# Altium schematic sheet DDR4_UDIMM CHANNEL-A0.schdoc
size 420 x 298 mm; Symbol: Sheet-Symbol_A3; Company: 嘉立创EDA; Version: V1.0; Page Size: A3; @Project Name: 【全网首发】X86电脑主板_copy; @Page Count: 2; @Update Date: 2025-11-04; @Create Date: 2025-11-04; @Schematic Name: SCHEMATIC1_1; @Page No: 0; @Page Name: DDR4_UDIMM CHANNEL-A0; Device: Sheet-Symbol_A3
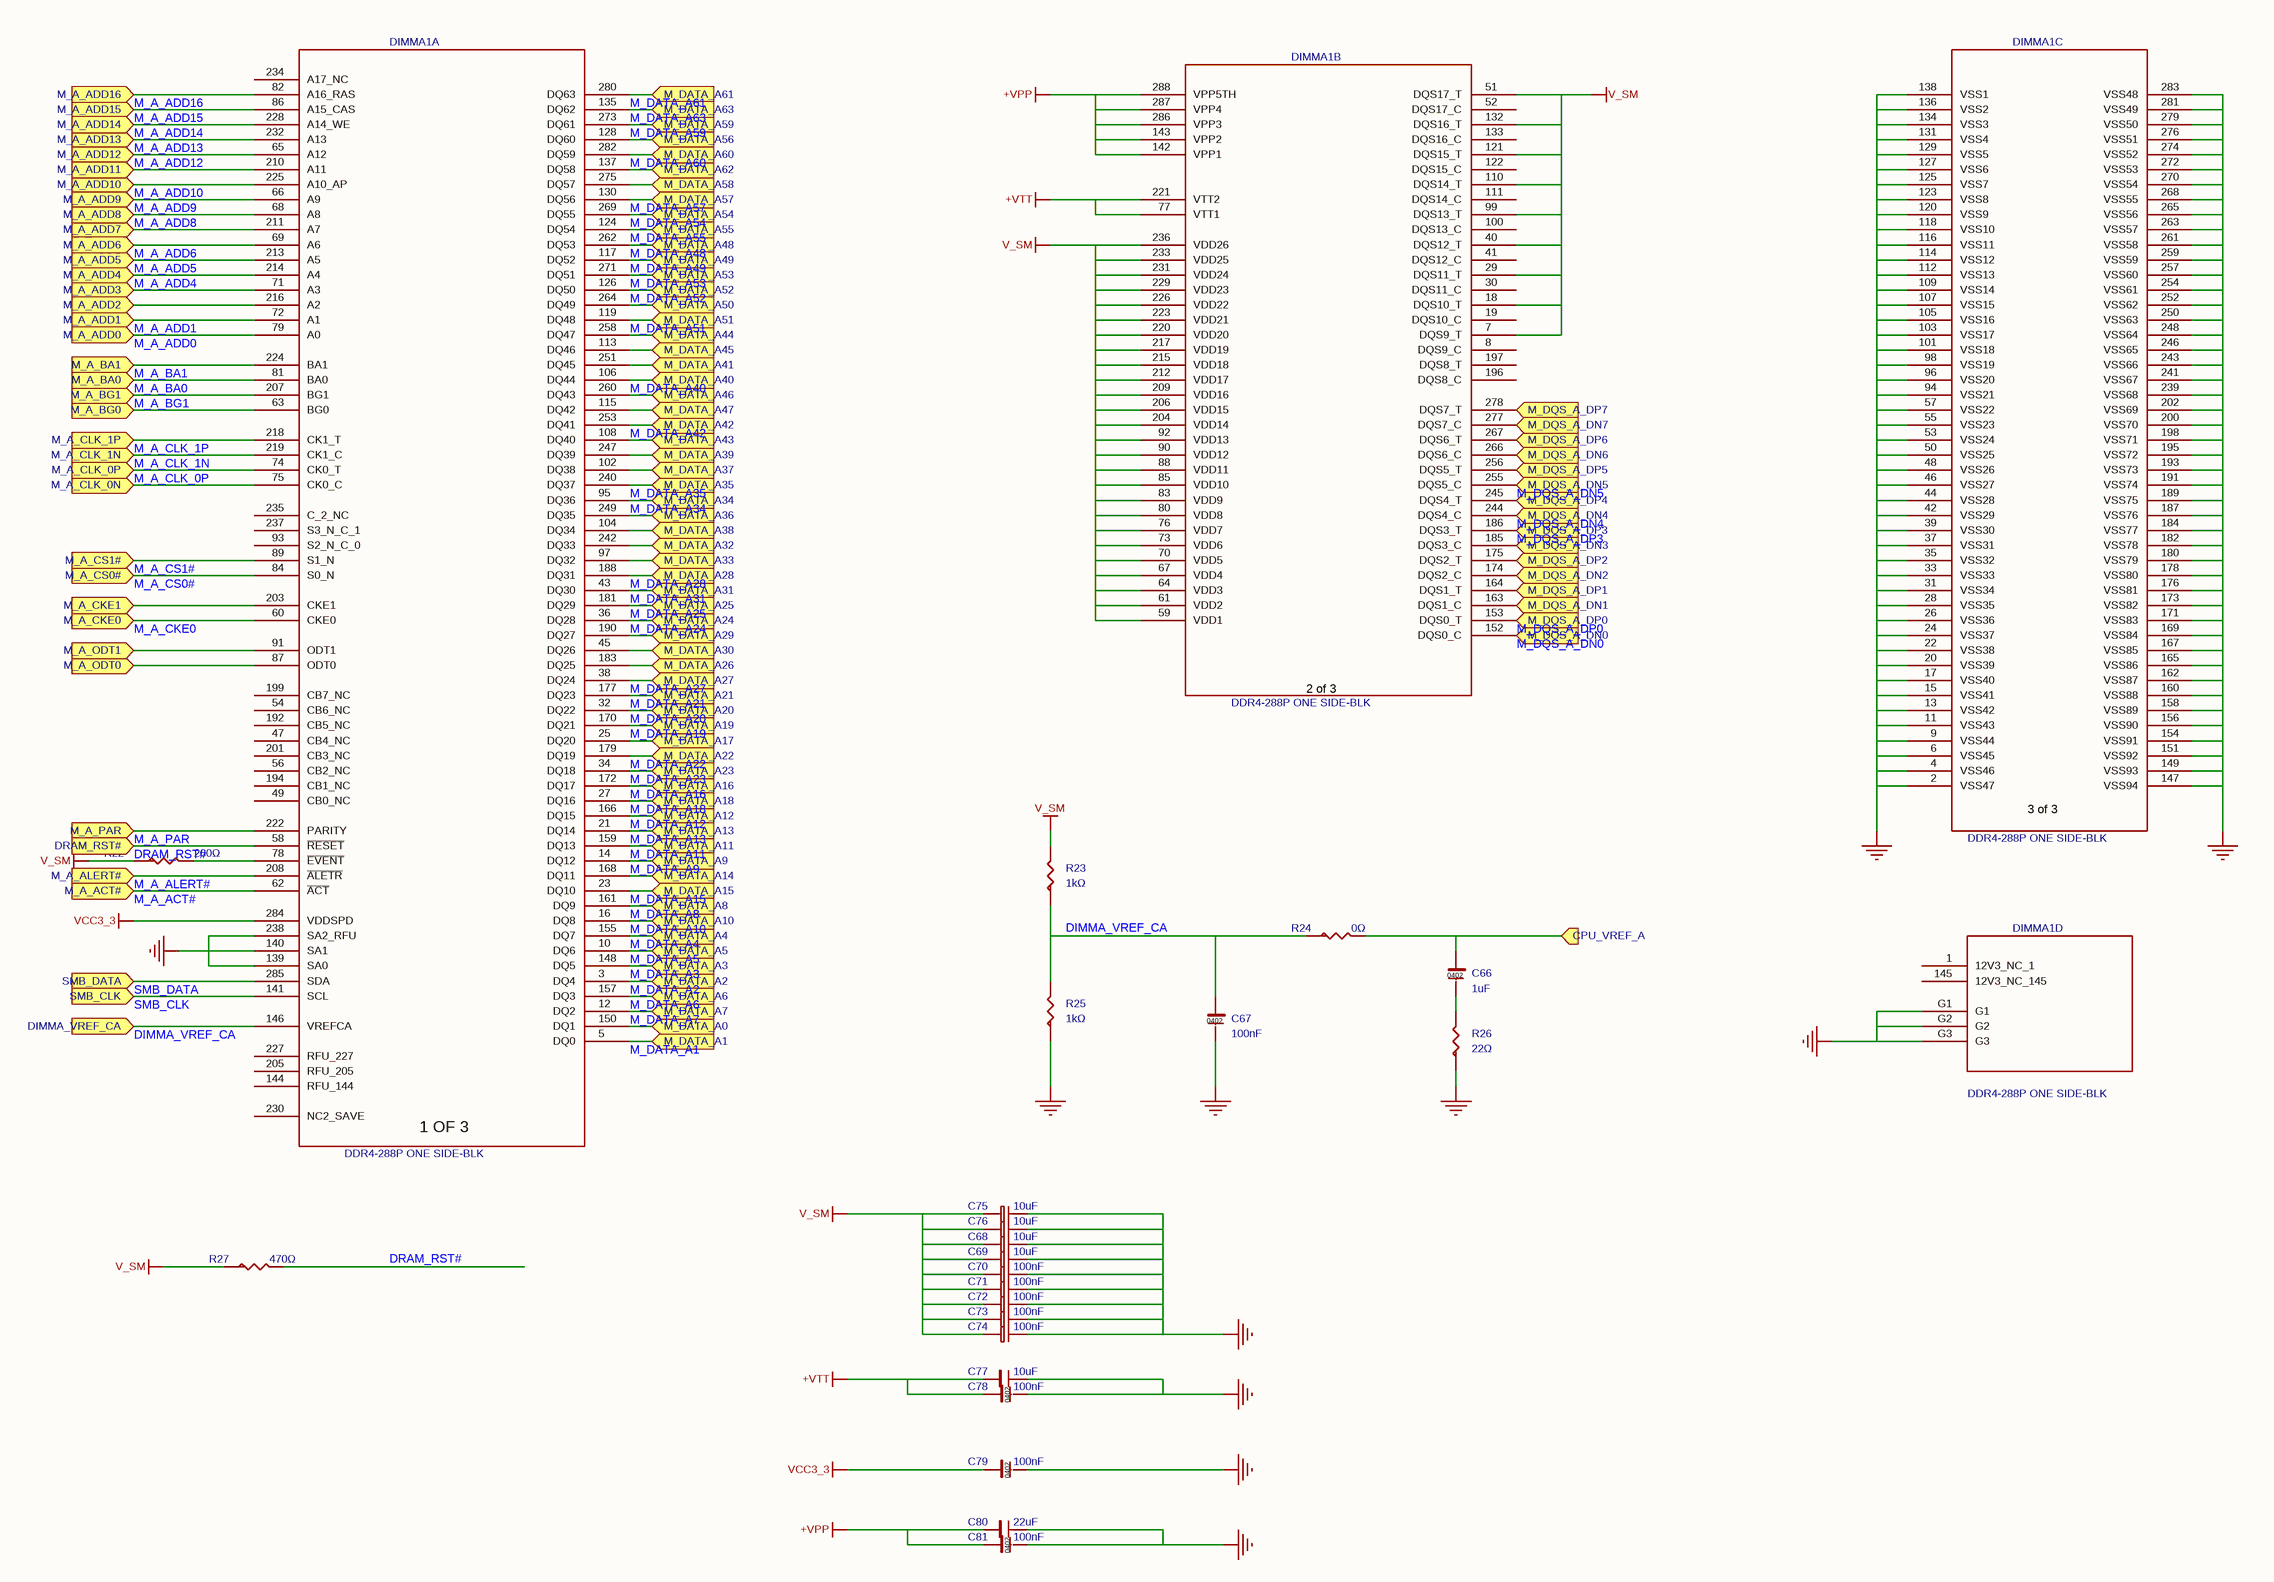
[diagram p0: DDR4_UDIMM CHANNEL-A0.schdoc]

## Parts
C66  1uF  [C0402_2]
C67  100nF  [C0402_1]
C68  10uF  [C0603_1]
C69  10uF  [C0603_1]
C70  100nF  [C0402_3]
C71  100nF  [C0402_1]
C72  100nF  [C0402_3]
C73  100nF  [C0402_3]
C74  100nF  [C0402_3]
C75  10uF  [C0603]
C76  10uF  [C0603_1]
C77  10uF  [C0603_2]
C78  100nF  [C0402_3]
C79  100nF  [C0402_3]
C80  22uF  [C0603_1]
C81  100nF  [C0402_3]
DIMMA1  value DDR4-288P ONE SIDE-BLK  [DDR4-288P-AKL_1]  (hidden comment: 90405-15112-2)  (parts A,B,C,D of 4)
R22  200Ω  [R0402_1]
R23  1kΩ  [R0402_3]
R24  0Ω  [R0402_3]
R25  1kΩ  [R0402_1]
R26  22Ω  [R0402]
R27  470Ω  [R0402_1]

## Ports
CPU_VREF_A (in), DIMMA_VREF_CA (in), DRAM_RST# (in), M_A_ACT# (in), M_A_ADD0 (in), M_A_ADD1 (in), M_A_ADD2 (in), M_A_ADD3 (in), M_A_ADD4 (in), M_A_ADD5 (in), M_A_ADD6 (in), M_A_ADD7 (in), M_A_ADD8 (in), M_A_ADD9 (in), M_A_ADD10 (in), M_A_ADD11 (in), M_A_ADD12 (in), M_A_ADD13 (in), M_A_ADD14 (in), M_A_ADD15 (in), M_A_ADD16 (in), M_A_ALERT# (in), M_A_BA0 (in), M_A_BA1 (in), M_A_BG0 (in), M_A_BG1 (in), M_A_CKE0 (in), M_A_CKE1 (in), M_A_CLK_0N (in), M_A_CLK_0P (in), M_A_CLK_1N (in), M_A_CLK_1P (in), M_A_CS0# (in), M_A_CS1# (in), M_A_ODT0 (in), M_A_ODT1 (in), M_A_PAR (in), M_DATA_A0 (in), M_DATA_A1 (in), M_DATA_A2 (in), M_DATA_A3 (in), M_DATA_A4 (in), M_DATA_A5 (in), M_DATA_A6 (in), M_DATA_A7 (in), M_DATA_A8 (in), M_DATA_A9 (in), M_DATA_A10 (in), M_DATA_A11 (in), M_DATA_A12 (in), M_DATA_A13 (in), M_DATA_A14 (in), M_DATA_A15 (in), M_DATA_A16 (in), M_DATA_A17 (in), M_DATA_A18 (in), M_DATA_A19 (in), M_DATA_A20 (in), M_DATA_A21 (in), M_DATA_A22 (in), M_DATA_A23 (in), M_DATA_A24 (in), M_DATA_A25 (in), M_DATA_A26 (in), M_DATA_A27 (in), M_DATA_A28 (in), M_DATA_A29 (in), M_DATA_A30 (in), M_DATA_A31 (in), M_DATA_A32 (in), M_DATA_A33 (in), M_DATA_A34 (in), M_DATA_A35 (in), M_DATA_A36 (in), M_DATA_A37 (in), M_DATA_A38 (in), M_DATA_A39 (in), M_DATA_A40 (in), M_DATA_A41 (in), M_DATA_A42 (in), M_DATA_A43 (in), M_DATA_A44 (in), M_DATA_A45 (in), M_DATA_A46 (in), M_DATA_A47 (in), M_DATA_A48 (in), M_DATA_A49 (in), M_DATA_A50 (in), M_DATA_A51 (in), M_DATA_A52 (in), M_DATA_A53 (in), M_DATA_A54 (in), M_DATA_A55 (in), M_DATA_A56 (in), M_DATA_A57 (in), M_DATA_A58 (in), M_DATA_A59 (in), M_DATA_A60 (in), M_DATA_A61 (in), M_DATA_A62 (in), M_DATA_A63 (in), M_DQS_A_DN0 (in), M_DQS_A_DN1 (in), M_DQS_A_DN2 (in), M_DQS_A_DN3 (in), M_DQS_A_DN4 (in), M_DQS_A_DN5 (in), M_DQS_A_DN6 (in), M_DQS_A_DN7 (in), M_DQS_A_DP0 (in), M_DQS_A_DP1 (in), M_DQS_A_DP2 (in), M_DQS_A_DP3 (in), M_DQS_A_DP4 (in), M_DQS_A_DP5 (in), M_DQS_A_DP6 (in), M_DQS_A_DP7 (in), SMB_CLK (in), SMB_DATA (in)

## Nets
+VPP: C80.1 C81.1 DIMMA1.142(VPP1) DIMMA1.143(VPP2) DIMMA1.286(VPP3) DIMMA1.287(VPP4) DIMMA1.288(VPP5TH)
+VTT: C77.1 C78.1 DIMMA1.77(VTT1) DIMMA1.221(VTT2)
GND: C67.2 C68.1 C69.1 C70.1 C71.1 C72.1 C73.1 C74.1 C75.1 C76.1 C77.2 C78.2 C79.2 C80.2 C81.2 DIMMA1.2(VSS47) DIMMA1.4(VSS46) DIMMA1.6(VSS45) DIMMA1.9(VSS44) DIMMA1.11(VSS43) DIMMA1.13(VSS42) DIMMA1.15(VSS41) DIMMA1.17(VSS40) DIMMA1.20(VSS39) DIMMA1.22(VSS38) DIMMA1.24(VSS37) DIMMA1.26(VSS36) DIMMA1.28(VSS35) DIMMA1.31(VSS34) DIMMA1.33(VSS33) DIMMA1.35(VSS32) DIMMA1.37(VSS31) DIMMA1.39(VSS30) DIMMA1.42(VSS29) DIMMA1.44(VSS28) DIMMA1.46(VSS27) DIMMA1.48(VSS26) DIMMA1.50(VSS25) DIMMA1.53(VSS24) DIMMA1.55(VSS23) DIMMA1.57(VSS22) DIMMA1.94(VSS21) DIMMA1.96(VSS20) DIMMA1.98(VSS19) DIMMA1.101(VSS18) DIMMA1.103(VSS17) DIMMA1.105(VSS16) DIMMA1.107(VSS15) DIMMA1.109(VSS14) DIMMA1.112(VSS13) DIMMA1.114(VSS12) DIMMA1.116(VSS11) DIMMA1.118(VSS10) DIMMA1.120(VSS9) DIMMA1.123(VSS8) DIMMA1.125(VSS7) DIMMA1.127(VSS6) DIMMA1.129(VSS5) DIMMA1.131(VSS4) DIMMA1.134(VSS3) DIMMA1.136(VSS2) DIMMA1.138(VSS1) DIMMA1.139(SA0) DIMMA1.140(SA1) DIMMA1.147(VSS94) DIMMA1.149(VSS93) DIMMA1.151(VSS92) DIMMA1.154(VSS91) DIMMA1.156(VSS90) DIMMA1.158(VSS89) DIMMA1.160(VSS88) DIMMA1.162(VSS87) DIMMA1.165(VSS86) DIMMA1.167(VSS85) DIMMA1.169(VSS84) DIMMA1.171(VSS83) DIMMA1.173(VSS82) DIMMA1.176(VSS81) DIMMA1.178(VSS80) DIMMA1.180(VSS79) DIMMA1.182(VSS78) DIMMA1.184(VSS77) DIMMA1.187(VSS76) DIMMA1.189(VSS75) DIMMA1.191(VSS74) DIMMA1.193(VSS73) DIMMA1.195(VSS72) DIMMA1.198(VSS71) DIMMA1.200(VSS70) DIMMA1.202(VSS69) DIMMA1.238(SA2_RFU) DIMMA1.239(VSS68) DIMMA1.241(VSS67) DIMMA1.243(VSS66) DIMMA1.246(VSS65) DIMMA1.248(VSS64) DIMMA1.250(VSS63) DIMMA1.252(VSS62) DIMMA1.254(VSS61) DIMMA1.257(VSS60) DIMMA1.259(VSS59) DIMMA1.261(VSS58) DIMMA1.263(VSS57) DIMMA1.265(VSS56) DIMMA1.268(VSS55) DIMMA1.270(VSS54) DIMMA1.272(VSS53) DIMMA1.274(VSS52) DIMMA1.276(VSS51) DIMMA1.279(VSS50) DIMMA1.281(VSS49) DIMMA1.283(VSS48) DIMMA1.G1 DIMMA1.G2 DIMMA1.G3 R25.1 R26.1
V_SM: C68.2 C69.2 C70.2 C71.2 C72.2 C73.2 C74.2 C75.2 C76.2 DIMMA1.7(DQS9_T) DIMMA1.18(DQS10_T) DIMMA1.29(DQS11_T) DIMMA1.40(DQS12_T) DIMMA1.51(DQS17_T) DIMMA1.59(VDD1) DIMMA1.61(VDD2) DIMMA1.64(VDD3) DIMMA1.67(VDD4) DIMMA1.70(VDD5) DIMMA1.73(VDD6) DIMMA1.76(VDD7) DIMMA1.80(VDD8) DIMMA1.83(VDD9) DIMMA1.85(VDD10) DIMMA1.88(VDD11) DIMMA1.90(VDD12) DIMMA1.92(VDD13) DIMMA1.99(DQS13_T) DIMMA1.110(DQS14_T) DIMMA1.121(DQS15_T) DIMMA1.132(DQS16_T) DIMMA1.204(VDD14) DIMMA1.206(VDD15) DIMMA1.209(VDD16) DIMMA1.212(VDD17) DIMMA1.215(VDD18) DIMMA1.217(VDD19) DIMMA1.220(VDD20) DIMMA1.223(VDD21) DIMMA1.226(VDD22) DIMMA1.229(VDD23) DIMMA1.231(VDD24) DIMMA1.233(VDD25) DIMMA1.236(VDD26) R22.1 R23.2 R27.1
VCC3_3: C79.1 DIMMA1.284(VDDSPD)
CPU_VREF_A: C66.1 R24.2 ; port CPU_VREF_A
DIMMA_VREF_CA: C67.1 DIMMA1.146(VREFCA) R23.1 R24.1 R25.2 ; port DIMMA_VREF_CA
DRAM_RST#: DIMMA1.58(~{RESET}) R27.2 ; port DRAM_RST#
M_A_ACT#: DIMMA1.62(~{ACT}) ; port M_A_ACT#
M_A_ADD0: DIMMA1.79(A0) ; port M_A_ADD0
M_A_ADD1: DIMMA1.72(A1) ; port M_A_ADD1
M_A_ADD2: DIMMA1.216(A2) ; port M_A_ADD2
M_A_ADD3: DIMMA1.71(A3) ; port M_A_ADD3
M_A_ADD4: DIMMA1.214(A4) ; port M_A_ADD4
M_A_ADD5: DIMMA1.213(A5) ; port M_A_ADD5
M_A_ADD6: DIMMA1.69(A6) ; port M_A_ADD6
M_A_ADD7: DIMMA1.211(A7) ; port M_A_ADD7
M_A_ADD8: DIMMA1.68(A8) ; port M_A_ADD8
M_A_ADD9: DIMMA1.66(A9) ; port M_A_ADD9
M_A_ADD10: DIMMA1.225(A10_AP) ; port M_A_ADD10
M_A_ADD11: DIMMA1.210(A11) ; port M_A_ADD11
M_A_ADD12: DIMMA1.65(A12) ; port M_A_ADD12
M_A_ADD13: DIMMA1.232(A13) ; port M_A_ADD13
M_A_ADD14: DIMMA1.228(A14_WE) ; port M_A_ADD14
M_A_ADD15: DIMMA1.86(A15_CAS) ; port M_A_ADD15
M_A_ADD16: DIMMA1.82(A16_RAS) ; port M_A_ADD16
M_A_ALERT#: DIMMA1.208(~{ALETR}) ; port M_A_ALERT#
M_A_BA0: DIMMA1.81(BA0) ; port M_A_BA0
M_A_BA1: DIMMA1.224(BA1) ; port M_A_BA1
M_A_BG0: DIMMA1.63(BG0) ; port M_A_BG0
M_A_BG1: DIMMA1.207(BG1) ; port M_A_BG1
M_A_CKE0: DIMMA1.60(CKE0) ; port M_A_CKE0
M_A_CKE1: DIMMA1.203(CKE1) ; port M_A_CKE1
M_A_CLK_0N: DIMMA1.75(CK0_C) ; port M_A_CLK_0N
M_A_CLK_0P: DIMMA1.74(CK0_T) ; port M_A_CLK_0P
M_A_CLK_1N: DIMMA1.219(CK1_C) ; port M_A_CLK_1N
M_A_CLK_1P: DIMMA1.218(CK1_T) ; port M_A_CLK_1P
M_A_CS0#: DIMMA1.84(S0_N) ; port M_A_CS0#
M_A_CS1#: DIMMA1.89(S1_N) ; port M_A_CS1#
M_A_ODT0: DIMMA1.87(ODT0) ; port M_A_ODT0
M_A_ODT1: DIMMA1.91(ODT1) ; port M_A_ODT1
M_A_PAR: DIMMA1.222(PARITY) ; port M_A_PAR
M_DATA_A0: DIMMA1.150(DQ1) ; port M_DATA_A0
M_DATA_A1: DIMMA1.5(DQ0) ; port M_DATA_A1
M_DATA_A2: DIMMA1.3(DQ4) ; port M_DATA_A2
M_DATA_A3: DIMMA1.148(DQ5) ; port M_DATA_A3
M_DATA_A4: DIMMA1.155(DQ7) ; port M_DATA_A4
M_DATA_A5: DIMMA1.10(DQ6) ; port M_DATA_A5
M_DATA_A6: DIMMA1.157(DQ3) ; port M_DATA_A6
M_DATA_A7: DIMMA1.12(DQ2) ; port M_DATA_A7
M_DATA_A8: DIMMA1.161(DQ9) ; port M_DATA_A8
M_DATA_A9: DIMMA1.14(DQ12) ; port M_DATA_A9
M_DATA_A10: DIMMA1.16(DQ8) ; port M_DATA_A10
M_DATA_A11: DIMMA1.159(DQ13) ; port M_DATA_A11
M_DATA_A12: DIMMA1.166(DQ15) ; port M_DATA_A12
M_DATA_A13: DIMMA1.21(DQ14) ; port M_DATA_A13
M_DATA_A14: DIMMA1.168(DQ11) ; port M_DATA_A14
M_DATA_A15: DIMMA1.23(DQ10) ; port M_DATA_A15
M_DATA_A16: DIMMA1.172(DQ17) ; port M_DATA_A16
M_DATA_A17: DIMMA1.25(DQ20) ; port M_DATA_A17
M_DATA_A18: DIMMA1.27(DQ16) ; port M_DATA_A18
M_DATA_A19: DIMMA1.170(DQ21) ; port M_DATA_A19
M_DATA_A20: DIMMA1.32(DQ22) ; port M_DATA_A20
M_DATA_A21: DIMMA1.177(DQ23) ; port M_DATA_A21
M_DATA_A22: DIMMA1.179(DQ19) ; port M_DATA_A22
M_DATA_A23: DIMMA1.34(DQ18) ; port M_DATA_A23
M_DATA_A24: DIMMA1.36(DQ28) ; port M_DATA_A24
M_DATA_A25: DIMMA1.181(DQ29) ; port M_DATA_A25
M_DATA_A26: DIMMA1.183(DQ25) ; port M_DATA_A26
M_DATA_A27: DIMMA1.38(DQ24) ; port M_DATA_A27
M_DATA_A28: DIMMA1.188(DQ31) ; port M_DATA_A28
M_DATA_A29: DIMMA1.190(DQ27) ; port M_DATA_A29
M_DATA_A30: DIMMA1.45(DQ26) ; port M_DATA_A30
M_DATA_A31: DIMMA1.43(DQ30) ; port M_DATA_A31
M_DATA_A32: DIMMA1.242(DQ33) ; port M_DATA_A32
M_DATA_A33: DIMMA1.97(DQ32) ; port M_DATA_A33
M_DATA_A34: DIMMA1.95(DQ36) ; port M_DATA_A34
M_DATA_A35: DIMMA1.240(DQ37) ; port M_DATA_A35
M_DATA_A36: DIMMA1.249(DQ35) ; port M_DATA_A36
M_DATA_A37: DIMMA1.102(DQ38) ; port M_DATA_A37
M_DATA_A38: DIMMA1.104(DQ34) ; port M_DATA_A38
M_DATA_A39: DIMMA1.247(DQ39) ; port M_DATA_A39
M_DATA_A40: DIMMA1.106(DQ44) ; port M_DATA_A40
M_DATA_A41: DIMMA1.251(DQ45) ; port M_DATA_A41
M_DATA_A42: DIMMA1.253(DQ41) ; port M_DATA_A42
M_DATA_A43: DIMMA1.108(DQ40) ; port M_DATA_A43
M_DATA_A44: DIMMA1.258(DQ47) ; port M_DATA_A44
M_DATA_A45: DIMMA1.113(DQ46) ; port M_DATA_A45
M_DATA_A46: DIMMA1.260(DQ43) ; port M_DATA_A46
M_DATA_A47: DIMMA1.115(DQ42) ; port M_DATA_A47
M_DATA_A48: DIMMA1.262(DQ53) ; port M_DATA_A48
M_DATA_A49: DIMMA1.117(DQ52) ; port M_DATA_A49
M_DATA_A50: DIMMA1.264(DQ49) ; port M_DATA_A50
M_DATA_A51: DIMMA1.119(DQ48) ; port M_DATA_A51
M_DATA_A52: DIMMA1.126(DQ50) ; port M_DATA_A52
M_DATA_A53: DIMMA1.271(DQ51) ; port M_DATA_A53
M_DATA_A54: DIMMA1.269(DQ55) ; port M_DATA_A54
M_DATA_A55: DIMMA1.124(DQ54) ; port M_DATA_A55
M_DATA_A56: DIMMA1.128(DQ60) ; port M_DATA_A56
M_DATA_A57: DIMMA1.130(DQ56) ; port M_DATA_A57
M_DATA_A58: DIMMA1.275(DQ57) ; port M_DATA_A58
M_DATA_A59: DIMMA1.273(DQ61) ; port M_DATA_A59
M_DATA_A60: DIMMA1.282(DQ59) ; port M_DATA_A60
M_DATA_A61: DIMMA1.280(DQ63) ; port M_DATA_A61
M_DATA_A62: DIMMA1.137(DQ58) ; port M_DATA_A62
M_DATA_A63: DIMMA1.135(DQ62) ; port M_DATA_A63
M_DQS_A_DN0: DIMMA1.152(DQS0_C) ; port M_DQS_A_DN0
M_DQS_A_DN1: DIMMA1.163(DQS1_C) ; port M_DQS_A_DN1
M_DQS_A_DN2: DIMMA1.174(DQS2_C) ; port M_DQS_A_DN2
M_DQS_A_DN3: DIMMA1.185(DQS3_C) ; port M_DQS_A_DN3
M_DQS_A_DN4: DIMMA1.244(DQS4_C) ; port M_DQS_A_DN4
M_DQS_A_DN5: DIMMA1.255(DQS5_C) ; port M_DQS_A_DN5
M_DQS_A_DN6: DIMMA1.266(DQS6_C) ; port M_DQS_A_DN6
M_DQS_A_DN7: DIMMA1.277(DQS7_C) ; port M_DQS_A_DN7
M_DQS_A_DP0: DIMMA1.153(DQS0_T) ; port M_DQS_A_DP0
M_DQS_A_DP1: DIMMA1.164(DQS1_T) ; port M_DQS_A_DP1
M_DQS_A_DP2: DIMMA1.175(DQS2_T) ; port M_DQS_A_DP2
M_DQS_A_DP3: DIMMA1.186(DQS3_T) ; port M_DQS_A_DP3
M_DQS_A_DP4: DIMMA1.245(DQS4_T) ; port M_DQS_A_DP4
M_DQS_A_DP5: DIMMA1.256(DQS5_T) ; port M_DQS_A_DP5
M_DQS_A_DP6: DIMMA1.267(DQS6_T) ; port M_DQS_A_DP6
M_DQS_A_DP7: DIMMA1.278(DQS7_T) ; port M_DQS_A_DP7
SMB_CLK: DIMMA1.141(SCL) ; port SMB_CLK
SMB_DATA: DIMMA1.285(SDA) ; port SMB_DATA
NetC66_2: C66.2 R26.2
NetDIMMA1_78: DIMMA1.78(~{EVENT}) R22.2

Not connected (* = marked no-connect by the designer): DIMMA1 1(12V3_NC_1) 8(DQS9_C) 19(DQS10_C) 30(DQS11_C) 41(DQS12_C) 47(CB4_NC) 49(CB0_NC) 52(DQS17_C) 54(CB6_NC) 56(CB2_NC) 93(S2_N_C_0) 100(DQS13_C) 111(DQS14_C) 122(DQS15_C) 133(DQS16_C) 144(RFU_144) 145(12V3_NC_145) 192(CB5_NC) 194(CB1_NC) 196(DQS8_C) 197(DQS8_T) 199(CB7_NC) 201(CB3_NC) 205(RFU_205) 227(RFU_227) 230(NC2_SAVE) 234(A17_NC) 235(C_2_NC) 237(S3_N_C_1)

## Notes on the sheet
- 更新日期
- 2025-11-04
- 原理图
- 图页
- SCHEMATIC1_1
- DDR4_UDIMM CHANNEL-A0
- 创建日期
- 物料编码
- 审阅
- 绘制
- 【全网首发】X86电脑主板_copy
- 版本
- V1.0
- 尺寸
- A3
- 页
- 0
- 嘉立创EDA
- 共
- 2
- (in symbol 90405-15112-2, part A) 1 OF 3
- (in symbol 90405-15112-2, part B) 2 of 3
- (in symbol 90405-15112-2, part C) 3 of 3

## Library data of the parts
C66 = CL05A105KQ5NNNC: 容值:1uF;精度:±10%;额定电压:6.3V;材质(温度系数):X5R;; Manufacturer: SAMSUNG(三星); Symbol: C0402; AddInBom: yes; ModelId: 36a51122f27c49738f86b3bfa98863e0; ModelName: C0402_L1.0-W0.5-H0.5; ModelTransform: 39.37,19.685,0,0,0,0,0,0,0; Tolerance: ±10%; Voltage Rated: 6.3V; Temperature Coefficient: X5R; Device: CL05A105KQ5NNNC; Value: 1uF; LCSC Part Name: 1uF ±10% 6.3V; SupplierPart: C107372; ManufacturerPart: CL05A105KQ5NNNC; Supplier Footprint: 0402; JLCPCB Part Class: Extended Part; Datasheet: https://atta.szlcsc.com/upload/public/pdf/source/20160218/1457707763339.pdf; Supplier: LCSC; ConvertToPcb: yes; FootprintName: C0402_2
C67 C78 C79 C81 = CL05B104KO5NNNC: 容值:100nF;精度:±10%;额定电压:16V;材质(温度系数):X7R;; Manufacturer: SAMSUNG(三星); Symbol: C0402; ModelId: 36a51122f27c49738f86b3bfa98863e0; Tolerance: ±10%; AddInBom: yes; Voltage Rated: 16V; ModelName: C0402_L1.0-W0.5-H0.5; ModelTransform: 39.37,19.685,0,0,0,0,0,0,0; Temperature Coefficient: X7R; Device: CL05B104KO5NNNC; Value: 100nF; Supplier: LCSC; Datasheet: https://atta.szlcsc.com/upload/public/pdf/source/20160103/1457707674891.pdf; SupplierPart: C1525; ConvertToPcb: yes; LCSC Part Name: 100nF ±10% 16V; JLCPCB Part Class: Basic Part; ManufacturerPart: CL05B104KO5NNNC; Supplier Footprint: 0402
  C67: FootprintName: C0402_1
  C78 C79 C81: FootprintName: C0402_3
C68 C69 C75 C76 = CL05A106MQ5NUNC: 容值:10uF;精度:±20%;额定电压:6.3V;材质(温度系数):X5R;; Manufacturer: SAMSUNG(三星); Symbol: CAP NP_23; ModelId: 36a51122f27c49738f86b3bfa98863e0; Tolerance: ±20%; AddInBom: yes; Voltage Rated: 6.3V; ModelName: C0402_L1.0-W0.5-H0.5; ModelTransform: 39.37,19.685,0,0,0,0,0,0,0; Temperature Coefficient: X5R; Device: CL05A106MQ5NUNC; Value: 10uF; Supplier: LCSC; Datasheet: https://atta.szlcsc.com/upload/public/pdf/source/20220823/2B02EE04F8F211D38A52DCB16EB6BEBA.pdf; SupplierPart: C15525; ConvertToPcb: yes; LCSC Part Name: 10uF ±20% 6.3V; JLCPCB Part Class: Basic Part; ManufacturerPart: CL05A106MQ5NUNC; Supplier Footprint: 0402
  C68 C69 C76: FootprintName: C0603_1
  C75: FootprintName: C0603
C70-C74 = CL05B104KO5NNNC: 容值:100nF;精度:±10%;额定电压:16V;材质(温度系数):X7R;; Manufacturer: SAMSUNG(三星); Symbol: CAP NP_23; ModelId: 36a51122f27c49738f86b3bfa98863e0; Tolerance: ±10%; AddInBom: yes; Voltage Rated: 16V; ModelName: C0402_L1.0-W0.5-H0.5; ModelTransform: 39.37,19.685,0,0,0,0,0,0,0; Temperature Coefficient: X7R; Device: CL05B104KO5NNNC; Value: 100nF; Supplier: LCSC; Datasheet: https://atta.szlcsc.com/upload/public/pdf/source/20160103/1457707674891.pdf; SupplierPart: C1525; ConvertToPcb: yes; LCSC Part Name: 100nF ±10% 16V; JLCPCB Part Class: Basic Part; ManufacturerPart: CL05B104KO5NNNC; Supplier Footprint: 0402
  C70 C72-C74: FootprintName: C0402_3
  C71: FootprintName: C0402_1
C77 = CL10A106KP8NNNC: 容值:10uF;精度:±10%;额定电压:10V;材质(温度系数):X5R;; Manufacturer: SAMSUNG(三星); Symbol: C0805; ModelId: ac125912035d415993ca9572d50418b1; Tolerance: ±10%; AddInBom: yes; Voltage Rated: 10V; ModelName: C0603_L1.6-W0.8-H0.8; ModelTransform: 62.992,31.496,0,0,0,0,0,0,0; Temperature Coefficient: X5R; Device: CL10A106KP8NNNC; Value: 10uF; Supplier: LCSC; Datasheet: https://atta.szlcsc.com/upload/public/pdf/source/20160103/1457707703378.pdf; FootprintName: C0603_2; SupplierPart: C19702; ConvertToPcb: yes; LCSC Part Name: 10uF ±10% 10V; JLCPCB Part Class: Basic Part; ManufacturerPart: CL10A106KP8NNNC; Supplier Footprint: 0603
C80 = CL10A226MQ8NRNC: 容值:22uF;精度:±20%;额定电压:6.3V;材质(温度系数):X5R;; Manufacturer: SAMSUNG(三星); Symbol: C0805; AddInBom: yes; Tolerance: ±20%; Voltage Rated: 6.3V; Temperature Coefficient: X5R; ModelId: ac125912035d415993ca9572d50418b1; ModelName: C0603_L1.6-W0.8-H0.8; ModelTransform: 62.992,31.496,0,0,0,0,0,0,0; Device: CL10A226MQ8NRNC; Value: 22uF; LCSC Part Name: 22uF ±20% 6.3V; SupplierPart: C59461; ManufacturerPart: CL10A226MQ8NRNC; Supplier Footprint: 0603; JLCPCB Part Class: Basic Part; Datasheet: https://atta.szlcsc.com/upload/public/pdf/source/20160218/1457707763339.pdf; Supplier: LCSC; ConvertToPcb: yes; FootprintName: C0603_1
DIMMA1 = 90405-15112-2: 连接器类型:DDR4;间距:0.85mm;引脚总数:288P;安装方式:直插;工作温度范围:-55℃~+105℃;; Manufacturer: UMaxconn(友贸); Symbol: DDR4_0; AddInBom: yes; ModelId: 99c36b498e914ce59dfe50adf1b55e89; ModelName: CONN-TH_288P-90405; ModelTransform: 5799.201,244.488,0,0,0,0,0,0,-157.48; Connector Type: DDR4; Pitch: 0.85mm; Device: 90405-15112-2; LCSC Part Name: 0.85mm P数:288P; SupplierPart: C2922446; ManufacturerPart: 90405-15112-2; Supplier Footprint: 插件,P=0.85mm; JLCPCB Part Class: Extended Part; Datasheet: https://atta.szlcsc.com/upload/public/pdf/source/20211119/8F83E07E75D2FB3E34252D81E838E37C.pdf; Supplier: LCSC; ConvertToPcb: yes; FootprintName: DDR4-288P-AKL_1; Number of Pins: 288P; Mounting Style: 直插; Height Above Board: 21mm; Contact Material: 铜合金; Contact Plating: 金; Operating Temperature Range: -55℃~+105℃
R22 = 0402WGF2000TCE: 电阻类型:厚膜电阻;阻值:200Ω;精度:±1%;功率:62.5mW;; Manufacturer: UNI-ROYAL(厚声); Symbol: 42A**-F; PCB Footprint: R0402; ModelId: 671aefced39d4c318694bba8bd8efd39; Tolerance: ±1%; AddInBom: yes; Power(Watts): 62.5mW; ModelName: R0402_L1.0-W0.5-H0.5; ModelTransform: 39.37,19.685,0,0,0,0,0,0.0005,0; Overload Voltage (Max): 50V; Temperature Coefficient: ±100ppm/℃; Device: 0402WGF2000TCE; Value: 200Ω; Type: 厚膜电阻; Supplier: LCSC; Datasheet: https://atta.szlcsc.com/upload/public/pdf/source/20200306/C422600_1E6D84923E4A46A82E41ADD87F860B5C.pdf; FootprintName: R0402_1; SupplierPart: C25087; ConvertToPcb: yes; LCSC Part Name: 200Ω ±1% 62.5mW; JLCPCB Part Class: Basic Part; ManufacturerPart: 0402WGF2000TCE; Supplier Footprint: 0402; Operating Temperature Range: -55℃~+155℃
R23 R25 = 0402WGF1001TCE: 电阻类型:厚膜电阻;阻值:1kΩ;精度:±1%;功率:62.5mW;; Manufacturer: UNI-ROYAL(厚声); Symbol: R; ModelId: 671aefced39d4c318694bba8bd8efd39; Tolerance: ±1%; AddInBom: yes; Power(Watts): 62.5mW; ModelName: R0402_L1.0-W0.5-H0.5; ModelTransform: 39.37,19.685,0,0,0,0,0,0.0005,0; Overload Voltage (Max): 50V; Temperature Coefficient: ±100ppm/℃; Device: 0402WGF1001TCE; Value: 1kΩ; Type: 厚膜电阻; Supplier: LCSC; Datasheet: https://atta.szlcsc.com/upload/public/pdf/source/20200306/C422600_1E6D84923E4A46A82E41ADD87F860B5C.pdf; SupplierPart: C11702; ConvertToPcb: yes; LCSC Part Name: 1kΩ ±1% 62.5mW; JLCPCB Part Class: Basic Part; ManufacturerPart: 0402WGF1001TCE; Supplier Footprint: 0402; Operating Temperature Range: -55℃~+155℃
  R23: FootprintName: R0402_3
  R25: FootprintName: R0402_1
R24 = 0402WGF0000TCE: 电阻类型:厚膜电阻;阻值:0Ω;精度:±1%;功率:62.5mW;; Manufacturer: UNI-ROYAL(厚声); Symbol: R; ModelId: 671aefced39d4c318694bba8bd8efd39; Tolerance: ±1%; AddInBom: yes; Power(Watts): 62.5mW; ModelName: R0402_L1.0-W0.5-H0.5; ModelTransform: 39.37,19.685,0,0,0,0,0,0.0005,0; Overload Voltage (Max): 50V; Temperature Coefficient: ±800ppm/℃; Device: 0402WGF0000TCE; Value: 0Ω; Type: 厚膜电阻; Supplier: LCSC; Datasheet: https://atta.szlcsc.com/upload/public/pdf/source/20200306/C422600_1E6D84923E4A46A82E41ADD87F860B5C.pdf; FootprintName: R0402_3; SupplierPart: C17168; ConvertToPcb: yes; LCSC Part Name: 0Ω ±1% 62.5mW; JLCPCB Part Class: Basic Part; ManufacturerPart: 0402WGF0000TCE; Supplier Footprint: 0402; Operating Temperature Range: -55℃~+155℃
R26 = 0402WGF220JTCE: 电阻类型:厚膜电阻;阻值:22Ω;精度:±1%;功率:62.5mW;温度系数:±100ppm/℃;; Manufacturer: UNI-ROYAL(厚声); Symbol: R; ModelId: 671aefced39d4c318694bba8bd8efd39; Tolerance: ±1%; AddInBom: yes; Power(Watts): 62.5mW; ModelName: R0402_L1.0-W0.5-H0.5; ModelTransform: 39.37,19.685,0,0,0,0,0,0.0005,0; Overload Voltage (Max): 50V; Device: 0402WGF220JTCE; Value: 22Ω; Type: 厚膜电阻; Supplier: LCSC; Datasheet: https://atta.szlcsc.com/upload/public/pdf/source/20200306/C422600_1E6D84923E4A46A82E41ADD87F860B5C.pdf; FootprintName: R0402; SupplierPart: C25092; ConvertToPcb: yes; LCSC Part Name: 厚膜电阻 22Ω ±1% 62.5mW; JLCPCB Part Class: Basic Part; ManufacturerPart: 0402WGF220JTCE; Supplier Footprint: 0402; Temperature Coefficient: ±100ppm/℃; Operating Temperature Range: -55℃~+155℃
R27 = 0402WGF4700TCE: 电阻类型:厚膜电阻;阻值:470Ω;精度:±1%;功率:62.5mW;; Manufacturer: UNI-ROYAL(厚声); Symbol: 42A**-F; PCB Footprint: R0402; ModelId: 671aefced39d4c318694bba8bd8efd39; Tolerance: ±1%; AddInBom: yes; Power(Watts): 62.5mW; ModelName: R0402_L1.0-W0.5-H0.5; ModelTransform: 39.37,19.685,0,0,0,0,0,0.0005,0; Overload Voltage (Max): 50V; Temperature Coefficient: ±100ppm/℃; Device: 0402WGF4700TCE; Value: 470Ω; Type: 厚膜电阻; Supplier: LCSC; Datasheet: https://atta.szlcsc.com/upload/public/pdf/source/20200306/C422600_1E6D84923E4A46A82E41ADD87F860B5C.pdf; FootprintName: R0402_1; SupplierPart: C25117; ConvertToPcb: yes; LCSC Part Name: 470Ω ±1% 62.5mW; JLCPCB Part Class: Basic Part; ManufacturerPart: 0402WGF4700TCE; Supplier Footprint: 0402; Operating Temperature Range: -55℃~+155℃